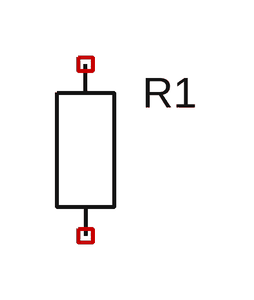
[diagram p0: schematic window_short_symbol.asc]
window_short_symbol.asc, the LTspice schematic file:
Version 4
SHEET 1 880 680
SYMBOL window_short 96 160 R0
SYMATTR InstName R1
SYMATTR Value 1k

The netlist it stands for:
* window_short_symbol.asc
R1 NC_01 NC_02 1k
.backanno
.end